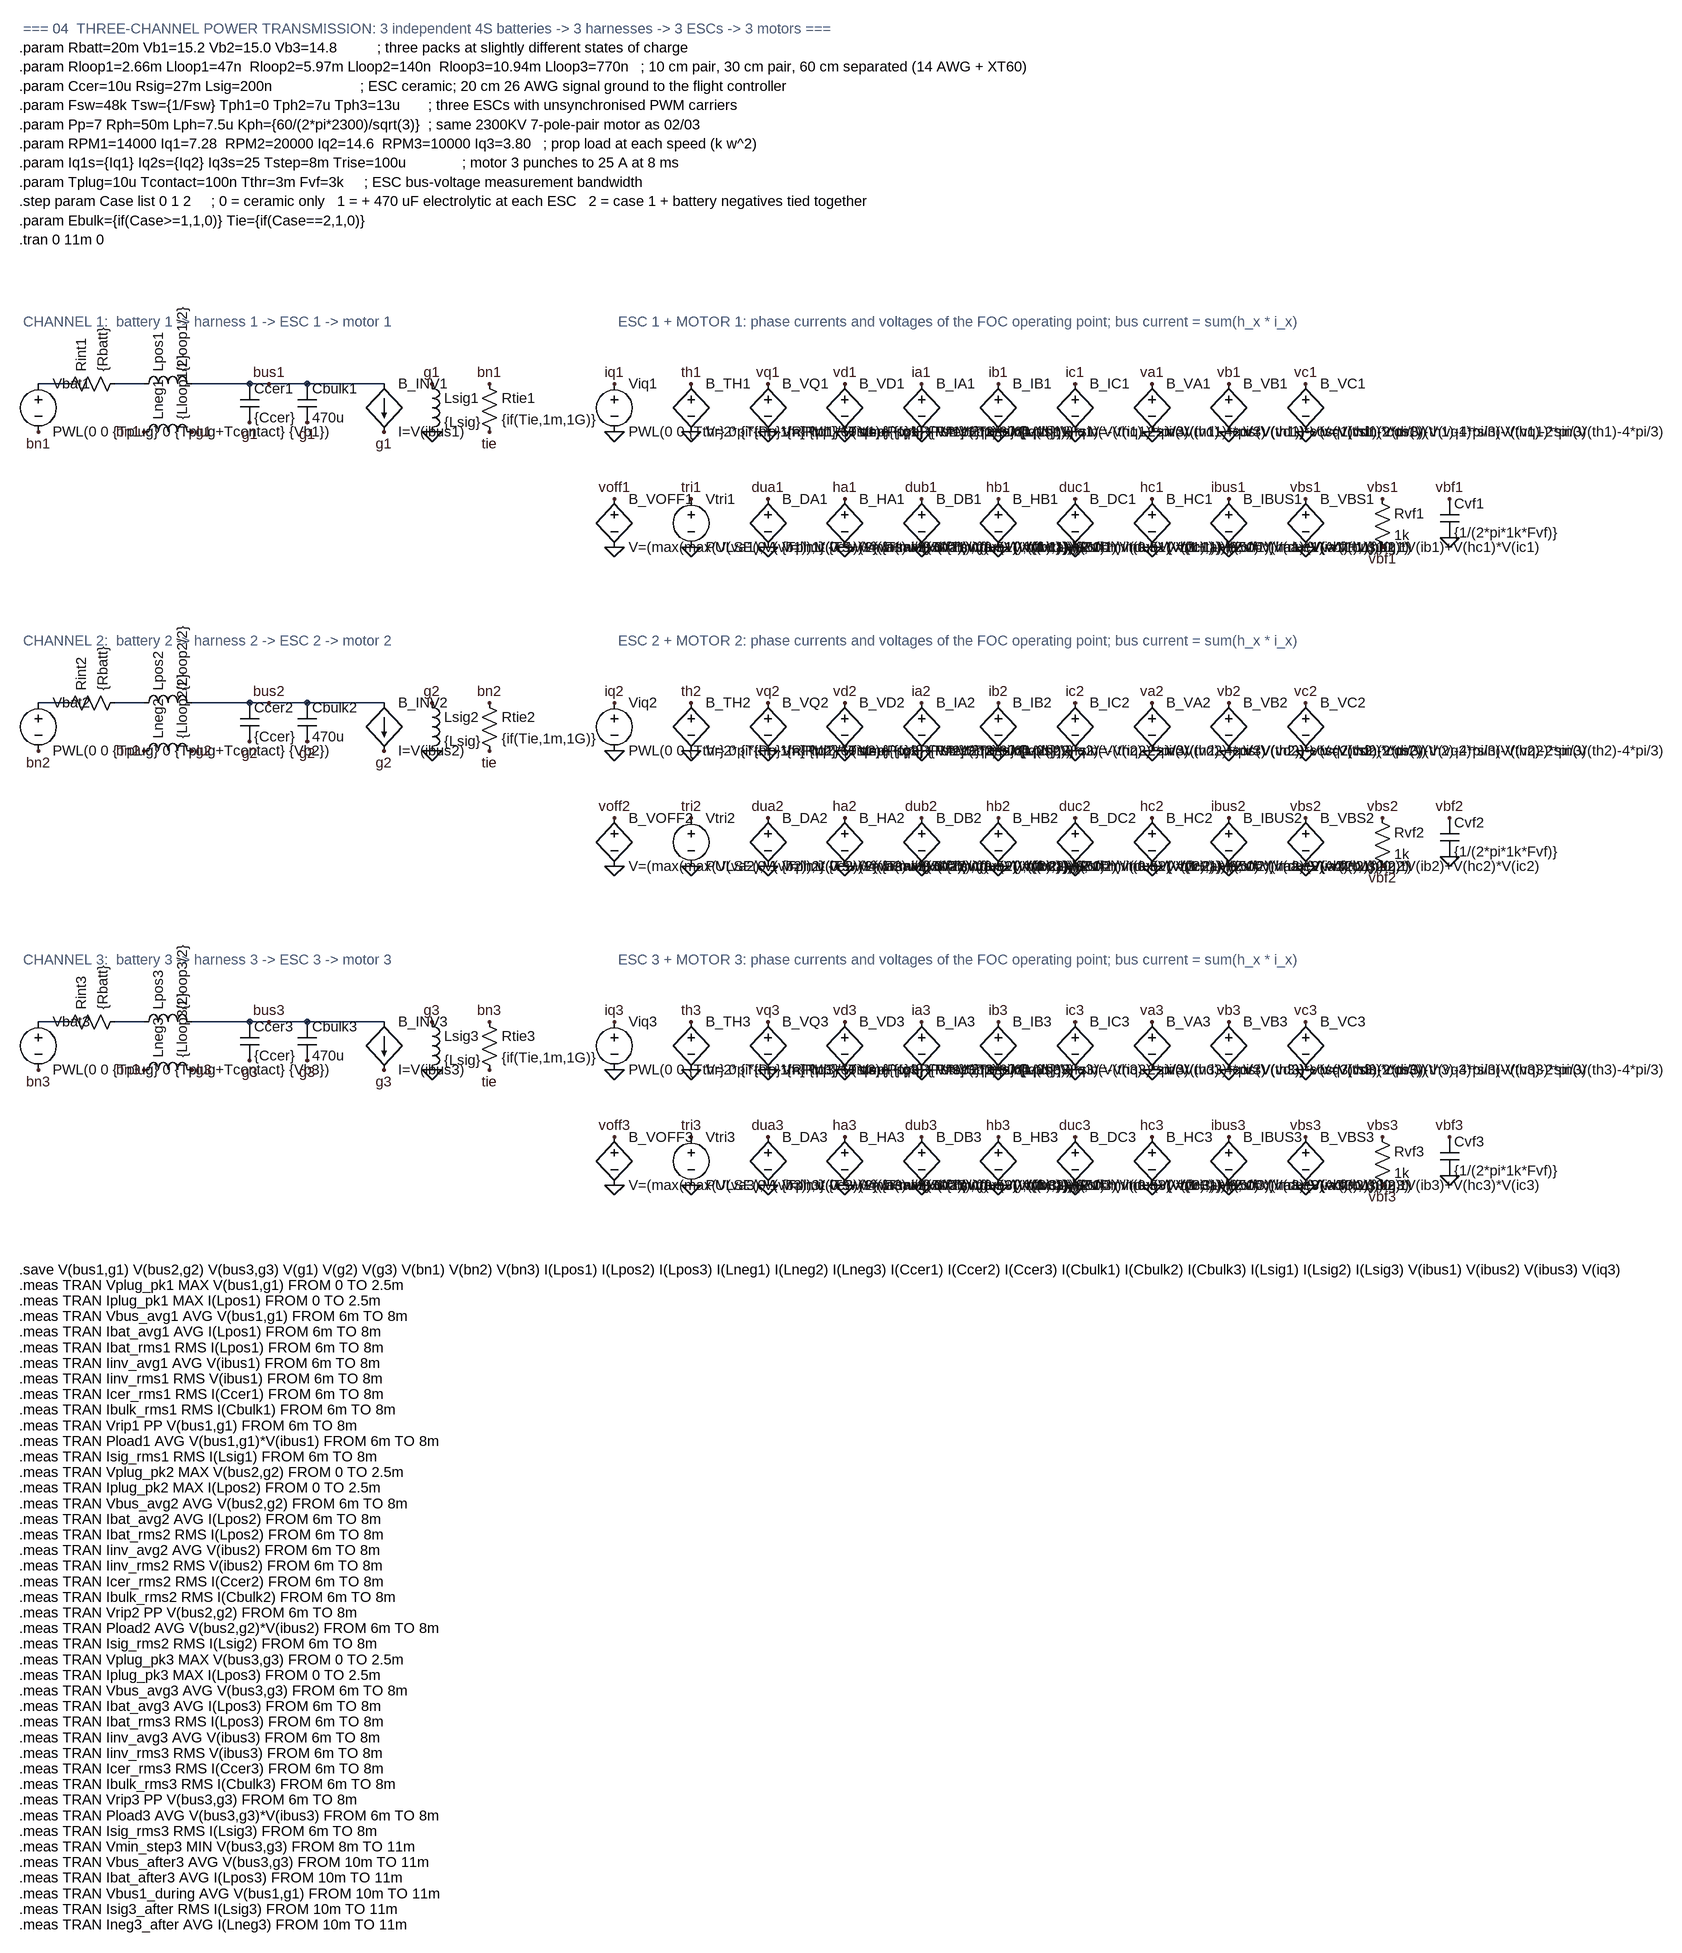
[diagram p0: schematic ThreeChannel_Transmission.asc]
ThreeChannel_Transmission.asc, the LTspice schematic file:
Version 4
SHEET 1 3600 2200
TEXT 32 40 Left 2 ; CHANNEL 1:  battery 1 -> harness 1 -> ESC 1 -> motor 1
SYMBOL voltage 64 128 R0
SYMATTR InstName Vbat1
SYMATTR Value PWL(0 0 {Tplug} 0 {Tplug+Tcontact} {Vb1})
FLAG 64 224 bn1
SYMBOL res 96 160 R270
SYMATTR InstName Rint1
SYMATTR Value {Rbatt}
WIRE 64 144 112 144
SYMBOL ind 224 160 R270
SYMATTR InstName Lpos1
SYMATTR Value {Lloop1/2}
SYMATTR SpiceLine Rser={Rloop1/2}
WIRE 192 144 240 144
SYMBOL ind 224 240 R270
SYMATTR InstName Lneg1
SYMATTR Value {Lloop1/2}
SYMATTR SpiceLine Rser={Rloop1/2}
FLAG 240 224 bn1
FLAG 320 224 g1
SYMBOL cap 400 144 R0
SYMATTR InstName Ccer1
SYMATTR Value {Ccer}
SYMATTR SpiceLine Rser=2m Lser=2n
FLAG 416 208 g1
SYMBOL cap 496 144 R0
SYMATTR InstName Cbulk1
SYMATTR Value 470u
SYMATTR SpiceLine Rser={if(Ebulk,30m,1Meg)} Lser=10n
FLAG 512 208 g1
WIRE 320 144 640 144
FLAG 448 144 bus1
SYMBOL bi 640 144 R0
SYMATTR InstName B_INV1
SYMATTR Value I=V(ibus1)
FLAG 640 224 g1
SYMBOL ind 704 128 R0
SYMATTR InstName Lsig1
SYMATTR Value {Lsig}
SYMATTR SpiceLine Rser={Rsig}
FLAG 720 144 g1
FLAG 720 224 0
SYMBOL res 800 128 R0
SYMATTR InstName Rtie1
SYMATTR Value {if(Tie,1m,1G)}
FLAG 816 144 bn1
FLAG 816 224 tie
SYMBOL voltage 1024 128 R0
SYMATTR InstName Viq1
SYMATTR Value PWL(0 0 {Tthr} 0 {Tthr+1m} {Iq1} {Tstep} {Iq1} {Tstep+Trise} {Iq1s})
FLAG 1024 144 iq1
FLAG 1024 224 0
SYMBOL bv 1152 128 R0
SYMATTR InstName B_TH1
SYMATTR Value V=2*pi*{Pp}*{RPM1}/60*time
FLAG 1152 144 th1
FLAG 1152 224 0
SYMBOL bv 1280 128 R0
SYMATTR InstName B_VQ1
SYMATTR Value V={Rph}*V(iq1)+{Kph}*{RPM1}*2*pi/60
FLAG 1280 144 vq1
FLAG 1280 224 0
SYMBOL bv 1408 128 R0
SYMATTR InstName B_VD1
SYMATTR Value V=-{Pp}*{RPM1}*2*pi/60*{Lph}*V(iq1)
FLAG 1408 144 vd1
FLAG 1408 224 0
SYMBOL bv 1536 128 R0
SYMATTR InstName B_IA1
SYMATTR Value V=-V(iq1)*sin(V(th1))
FLAG 1536 144 ia1
FLAG 1536 224 0
SYMBOL bv 1920 128 R0
SYMATTR InstName B_VA1
SYMATTR Value V=V(vd1)*cos(V(th1))-V(vq1)*sin(V(th1))
FLAG 1920 144 va1
FLAG 1920 224 0
SYMBOL bv 1664 128 R0
SYMATTR InstName B_IB1
SYMATTR Value V=-V(iq1)*sin(V(th1)-2*pi/3)
FLAG 1664 144 ib1
FLAG 1664 224 0
SYMBOL bv 2048 128 R0
SYMATTR InstName B_VB1
SYMATTR Value V=V(vd1)*cos(V(th1)-2*pi/3)-V(vq1)*sin(V(th1)-2*pi/3)
FLAG 2048 144 vb1
FLAG 2048 224 0
SYMBOL bv 1792 128 R0
SYMATTR InstName B_IC1
SYMATTR Value V=-V(iq1)*sin(V(th1)-4*pi/3)
FLAG 1792 144 ic1
FLAG 1792 224 0
SYMBOL bv 2176 128 R0
SYMATTR InstName B_VC1
SYMATTR Value V=V(vd1)*cos(V(th1)-4*pi/3)-V(vq1)*sin(V(th1)-4*pi/3)
FLAG 2176 144 vc1
FLAG 2176 224 0
SYMBOL bv 1024 320 R0
SYMATTR InstName B_VOFF1
SYMATTR Value V=(max(max(V(va1),V(vb1)),V(vc1))+min(min(V(va1),V(vb1)),V(vc1)))/2
FLAG 1024 336 voff1
FLAG 1024 416 0
SYMBOL voltage 1152 320 R0
SYMATTR InstName Vtri1
SYMATTR Value PULSE(0 1 {Tph1} {Tsw/2} {Tsw/2} 0 {Tsw})
FLAG 1152 336 tri1
FLAG 1152 416 0
SYMBOL bv 1280 320 R0
SYMATTR InstName B_DA1
SYMATTR Value V=limit(0.5+(V(va1)-V(voff1))/max(V(vbf1),1), 0, 1)
FLAG 1280 336 dua1
FLAG 1280 416 0
SYMBOL bv 1408 320 R0
SYMATTR InstName B_HA1
SYMATTR Value V=(1+tanh(500*(V(dua1)-V(tri1))))/2
FLAG 1408 336 ha1
FLAG 1408 416 0
SYMBOL bv 1536 320 R0
SYMATTR InstName B_DB1
SYMATTR Value V=limit(0.5+(V(vb1)-V(voff1))/max(V(vbf1),1), 0, 1)
FLAG 1536 336 dub1
FLAG 1536 416 0
SYMBOL bv 1664 320 R0
SYMATTR InstName B_HB1
SYMATTR Value V=(1+tanh(500*(V(dub1)-V(tri1))))/2
FLAG 1664 336 hb1
FLAG 1664 416 0
SYMBOL bv 1792 320 R0
SYMATTR InstName B_DC1
SYMATTR Value V=limit(0.5+(V(vc1)-V(voff1))/max(V(vbf1),1), 0, 1)
FLAG 1792 336 duc1
FLAG 1792 416 0
SYMBOL bv 1920 320 R0
SYMATTR InstName B_HC1
SYMATTR Value V=(1+tanh(500*(V(duc1)-V(tri1))))/2
FLAG 1920 336 hc1
FLAG 1920 416 0
SYMBOL bv 2048 320 R0
SYMATTR InstName B_IBUS1
SYMATTR Value V=V(ha1)*V(ia1)+V(hb1)*V(ib1)+V(hc1)*V(ic1)
FLAG 2048 336 ibus1
FLAG 2048 416 0
SYMBOL bv 2176 320 R0
SYMATTR InstName B_VBS1
SYMATTR Value V=V(bus1,g1)
FLAG 2176 336 vbs1
FLAG 2176 416 0
SYMBOL res 2288 320 R0
SYMATTR InstName Rvf1
SYMATTR Value 1k
FLAG 2304 336 vbs1
FLAG 2304 416 vbf1
SYMBOL cap 2400 336 R0
SYMATTR InstName Cvf1
SYMATTR Value {1/(2*pi*1k*Fvf)}
FLAG 2416 336 vbf1
FLAG 2416 400 0
TEXT 1024 40 Left 2 ; ESC 1 + MOTOR 1: phase currents and voltages of the FOC operating point; bus current = sum(h_x * i_x)
TEXT 32 600 Left 2 ; CHANNEL 2:  battery 2 -> harness 2 -> ESC 2 -> motor 2
SYMBOL voltage 64 688 R0
SYMATTR InstName Vbat2
SYMATTR Value PWL(0 0 {Tplug} 0 {Tplug+Tcontact} {Vb2})
FLAG 64 784 bn2
SYMBOL res 96 720 R270
SYMATTR InstName Rint2
SYMATTR Value {Rbatt}
WIRE 64 704 112 704
SYMBOL ind 224 720 R270
SYMATTR InstName Lpos2
SYMATTR Value {Lloop2/2}
SYMATTR SpiceLine Rser={Rloop2/2}
WIRE 192 704 240 704
SYMBOL ind 224 800 R270
SYMATTR InstName Lneg2
SYMATTR Value {Lloop2/2}
SYMATTR SpiceLine Rser={Rloop2/2}
FLAG 240 784 bn2
FLAG 320 784 g2
SYMBOL cap 400 704 R0
SYMATTR InstName Ccer2
SYMATTR Value {Ccer}
SYMATTR SpiceLine Rser=2m Lser=2n
FLAG 416 768 g2
SYMBOL cap 496 704 R0
SYMATTR InstName Cbulk2
SYMATTR Value 470u
SYMATTR SpiceLine Rser={if(Ebulk,30m,1Meg)} Lser=10n
FLAG 512 768 g2
WIRE 320 704 640 704
FLAG 448 704 bus2
SYMBOL bi 640 704 R0
SYMATTR InstName B_INV2
SYMATTR Value I=V(ibus2)
FLAG 640 784 g2
SYMBOL ind 704 688 R0
SYMATTR InstName Lsig2
SYMATTR Value {Lsig}
SYMATTR SpiceLine Rser={Rsig}
FLAG 720 704 g2
FLAG 720 784 0
SYMBOL res 800 688 R0
SYMATTR InstName Rtie2
SYMATTR Value {if(Tie,1m,1G)}
FLAG 816 704 bn2
FLAG 816 784 tie
SYMBOL voltage 1024 688 R0
SYMATTR InstName Viq2
SYMATTR Value PWL(0 0 {Tthr} 0 {Tthr+1m} {Iq2} {Tstep} {Iq2} {Tstep+Trise} {Iq2s})
FLAG 1024 704 iq2
FLAG 1024 784 0
SYMBOL bv 1152 688 R0
SYMATTR InstName B_TH2
SYMATTR Value V=2*pi*{Pp}*{RPM2}/60*time
FLAG 1152 704 th2
FLAG 1152 784 0
SYMBOL bv 1280 688 R0
SYMATTR InstName B_VQ2
SYMATTR Value V={Rph}*V(iq2)+{Kph}*{RPM2}*2*pi/60
FLAG 1280 704 vq2
FLAG 1280 784 0
SYMBOL bv 1408 688 R0
SYMATTR InstName B_VD2
SYMATTR Value V=-{Pp}*{RPM2}*2*pi/60*{Lph}*V(iq2)
FLAG 1408 704 vd2
FLAG 1408 784 0
SYMBOL bv 1536 688 R0
SYMATTR InstName B_IA2
SYMATTR Value V=-V(iq2)*sin(V(th2))
FLAG 1536 704 ia2
FLAG 1536 784 0
SYMBOL bv 1920 688 R0
SYMATTR InstName B_VA2
SYMATTR Value V=V(vd2)*cos(V(th2))-V(vq2)*sin(V(th2))
FLAG 1920 704 va2
FLAG 1920 784 0
SYMBOL bv 1664 688 R0
SYMATTR InstName B_IB2
SYMATTR Value V=-V(iq2)*sin(V(th2)-2*pi/3)
FLAG 1664 704 ib2
FLAG 1664 784 0
SYMBOL bv 2048 688 R0
SYMATTR InstName B_VB2
SYMATTR Value V=V(vd2)*cos(V(th2)-2*pi/3)-V(vq2)*sin(V(th2)-2*pi/3)
FLAG 2048 704 vb2
FLAG 2048 784 0
SYMBOL bv 1792 688 R0
SYMATTR InstName B_IC2
SYMATTR Value V=-V(iq2)*sin(V(th2)-4*pi/3)
FLAG 1792 704 ic2
FLAG 1792 784 0
SYMBOL bv 2176 688 R0
SYMATTR InstName B_VC2
SYMATTR Value V=V(vd2)*cos(V(th2)-4*pi/3)-V(vq2)*sin(V(th2)-4*pi/3)
FLAG 2176 704 vc2
FLAG 2176 784 0
SYMBOL bv 1024 880 R0
SYMATTR InstName B_VOFF2
SYMATTR Value V=(max(max(V(va2),V(vb2)),V(vc2))+min(min(V(va2),V(vb2)),V(vc2)))/2
FLAG 1024 896 voff2
FLAG 1024 976 0
SYMBOL voltage 1152 880 R0
SYMATTR InstName Vtri2
SYMATTR Value PULSE(0 1 {Tph2} {Tsw/2} {Tsw/2} 0 {Tsw})
FLAG 1152 896 tri2
FLAG 1152 976 0
SYMBOL bv 1280 880 R0
SYMATTR InstName B_DA2
SYMATTR Value V=limit(0.5+(V(va2)-V(voff2))/max(V(vbf2),1), 0, 1)
FLAG 1280 896 dua2
FLAG 1280 976 0
SYMBOL bv 1408 880 R0
SYMATTR InstName B_HA2
SYMATTR Value V=(1+tanh(500*(V(dua2)-V(tri2))))/2
FLAG 1408 896 ha2
FLAG 1408 976 0
SYMBOL bv 1536 880 R0
SYMATTR InstName B_DB2
SYMATTR Value V=limit(0.5+(V(vb2)-V(voff2))/max(V(vbf2),1), 0, 1)
FLAG 1536 896 dub2
FLAG 1536 976 0
SYMBOL bv 1664 880 R0
SYMATTR InstName B_HB2
SYMATTR Value V=(1+tanh(500*(V(dub2)-V(tri2))))/2
FLAG 1664 896 hb2
FLAG 1664 976 0
SYMBOL bv 1792 880 R0
SYMATTR InstName B_DC2
SYMATTR Value V=limit(0.5+(V(vc2)-V(voff2))/max(V(vbf2),1), 0, 1)
FLAG 1792 896 duc2
FLAG 1792 976 0
SYMBOL bv 1920 880 R0
SYMATTR InstName B_HC2
SYMATTR Value V=(1+tanh(500*(V(duc2)-V(tri2))))/2
FLAG 1920 896 hc2
FLAG 1920 976 0
SYMBOL bv 2048 880 R0
SYMATTR InstName B_IBUS2
SYMATTR Value V=V(ha2)*V(ia2)+V(hb2)*V(ib2)+V(hc2)*V(ic2)
FLAG 2048 896 ibus2
FLAG 2048 976 0
SYMBOL bv 2176 880 R0
SYMATTR InstName B_VBS2
SYMATTR Value V=V(bus2,g2)
FLAG 2176 896 vbs2
FLAG 2176 976 0
SYMBOL res 2288 880 R0
SYMATTR InstName Rvf2
SYMATTR Value 1k
FLAG 2304 896 vbs2
FLAG 2304 976 vbf2
SYMBOL cap 2400 896 R0
SYMATTR InstName Cvf2
SYMATTR Value {1/(2*pi*1k*Fvf)}
FLAG 2416 896 vbf2
FLAG 2416 960 0
TEXT 1024 600 Left 2 ; ESC 2 + MOTOR 2: phase currents and voltages of the FOC operating point; bus current = sum(h_x * i_x)
TEXT 32 1160 Left 2 ; CHANNEL 3:  battery 3 -> harness 3 -> ESC 3 -> motor 3
SYMBOL voltage 64 1248 R0
SYMATTR InstName Vbat3
SYMATTR Value PWL(0 0 {Tplug} 0 {Tplug+Tcontact} {Vb3})
FLAG 64 1344 bn3
SYMBOL res 96 1280 R270
SYMATTR InstName Rint3
SYMATTR Value {Rbatt}
WIRE 64 1264 112 1264
SYMBOL ind 224 1280 R270
SYMATTR InstName Lpos3
SYMATTR Value {Lloop3/2}
SYMATTR SpiceLine Rser={Rloop3/2}
WIRE 192 1264 240 1264
SYMBOL ind 224 1360 R270
SYMATTR InstName Lneg3
SYMATTR Value {Lloop3/2}
SYMATTR SpiceLine Rser={Rloop3/2}
FLAG 240 1344 bn3
FLAG 320 1344 g3
SYMBOL cap 400 1264 R0
SYMATTR InstName Ccer3
SYMATTR Value {Ccer}
SYMATTR SpiceLine Rser=2m Lser=2n
FLAG 416 1328 g3
SYMBOL cap 496 1264 R0
SYMATTR InstName Cbulk3
SYMATTR Value 470u
SYMATTR SpiceLine Rser={if(Ebulk,30m,1Meg)} Lser=10n
FLAG 512 1328 g3
WIRE 320 1264 640 1264
FLAG 448 1264 bus3
SYMBOL bi 640 1264 R0
SYMATTR InstName B_INV3
SYMATTR Value I=V(ibus3)
FLAG 640 1344 g3
SYMBOL ind 704 1248 R0
SYMATTR InstName Lsig3
SYMATTR Value {Lsig}
SYMATTR SpiceLine Rser={Rsig}
FLAG 720 1264 g3
FLAG 720 1344 0
SYMBOL res 800 1248 R0
SYMATTR InstName Rtie3
SYMATTR Value {if(Tie,1m,1G)}
FLAG 816 1264 bn3
FLAG 816 1344 tie
SYMBOL voltage 1024 1248 R0
SYMATTR InstName Viq3
SYMATTR Value PWL(0 0 {Tthr} 0 {Tthr+1m} {Iq3} {Tstep} {Iq3} {Tstep+Trise} {Iq3s})
FLAG 1024 1264 iq3
FLAG 1024 1344 0
SYMBOL bv 1152 1248 R0
SYMATTR InstName B_TH3
SYMATTR Value V=2*pi*{Pp}*{RPM3}/60*time
FLAG 1152 1264 th3
FLAG 1152 1344 0
SYMBOL bv 1280 1248 R0
SYMATTR InstName B_VQ3
SYMATTR Value V={Rph}*V(iq3)+{Kph}*{RPM3}*2*pi/60
FLAG 1280 1264 vq3
FLAG 1280 1344 0
SYMBOL bv 1408 1248 R0
SYMATTR InstName B_VD3
SYMATTR Value V=-{Pp}*{RPM3}*2*pi/60*{Lph}*V(iq3)
FLAG 1408 1264 vd3
FLAG 1408 1344 0
SYMBOL bv 1536 1248 R0
SYMATTR InstName B_IA3
SYMATTR Value V=-V(iq3)*sin(V(th3))
FLAG 1536 1264 ia3
FLAG 1536 1344 0
SYMBOL bv 1920 1248 R0
SYMATTR InstName B_VA3
SYMATTR Value V=V(vd3)*cos(V(th3))-V(vq3)*sin(V(th3))
FLAG 1920 1264 va3
FLAG 1920 1344 0
SYMBOL bv 1664 1248 R0
SYMATTR InstName B_IB3
SYMATTR Value V=-V(iq3)*sin(V(th3)-2*pi/3)
FLAG 1664 1264 ib3
FLAG 1664 1344 0
SYMBOL bv 2048 1248 R0
SYMATTR InstName B_VB3
SYMATTR Value V=V(vd3)*cos(V(th3)-2*pi/3)-V(vq3)*sin(V(th3)-2*pi/3)
FLAG 2048 1264 vb3
FLAG 2048 1344 0
SYMBOL bv 1792 1248 R0
SYMATTR InstName B_IC3
SYMATTR Value V=-V(iq3)*sin(V(th3)-4*pi/3)
FLAG 1792 1264 ic3
FLAG 1792 1344 0
SYMBOL bv 2176 1248 R0
SYMATTR InstName B_VC3
SYMATTR Value V=V(vd3)*cos(V(th3)-4*pi/3)-V(vq3)*sin(V(th3)-4*pi/3)
FLAG 2176 1264 vc3
FLAG 2176 1344 0
SYMBOL bv 1024 1440 R0
SYMATTR InstName B_VOFF3
SYMATTR Value V=(max(max(V(va3),V(vb3)),V(vc3))+min(min(V(va3),V(vb3)),V(vc3)))/2
FLAG 1024 1456 voff3
FLAG 1024 1536 0
SYMBOL voltage 1152 1440 R0
SYMATTR InstName Vtri3
SYMATTR Value PULSE(0 1 {Tph3} {Tsw/2} {Tsw/2} 0 {Tsw})
FLAG 1152 1456 tri3
FLAG 1152 1536 0
SYMBOL bv 1280 1440 R0
SYMATTR InstName B_DA3
SYMATTR Value V=limit(0.5+(V(va3)-V(voff3))/max(V(vbf3),1), 0, 1)
FLAG 1280 1456 dua3
FLAG 1280 1536 0
SYMBOL bv 1408 1440 R0
SYMATTR InstName B_HA3
SYMATTR Value V=(1+tanh(500*(V(dua3)-V(tri3))))/2
FLAG 1408 1456 ha3
FLAG 1408 1536 0
SYMBOL bv 1536 1440 R0
SYMATTR InstName B_DB3
SYMATTR Value V=limit(0.5+(V(vb3)-V(voff3))/max(V(vbf3),1), 0, 1)
FLAG 1536 1456 dub3
FLAG 1536 1536 0
SYMBOL bv 1664 1440 R0
SYMATTR InstName B_HB3
SYMATTR Value V=(1+tanh(500*(V(dub3)-V(tri3))))/2
FLAG 1664 1456 hb3
FLAG 1664 1536 0
SYMBOL bv 1792 1440 R0
SYMATTR InstName B_DC3
SYMATTR Value V=limit(0.5+(V(vc3)-V(voff3))/max(V(vbf3),1), 0, 1)
FLAG 1792 1456 duc3
FLAG 1792 1536 0
SYMBOL bv 1920 1440 R0
SYMATTR InstName B_HC3
SYMATTR Value V=(1+tanh(500*(V(duc3)-V(tri3))))/2
FLAG 1920 1456 hc3
FLAG 1920 1536 0
SYMBOL bv 2048 1440 R0
SYMATTR InstName B_IBUS3
SYMATTR Value V=V(ha3)*V(ia3)+V(hb3)*V(ib3)+V(hc3)*V(ic3)
FLAG 2048 1456 ibus3
FLAG 2048 1536 0
SYMBOL bv 2176 1440 R0
SYMATTR InstName B_VBS3
SYMATTR Value V=V(bus3,g3)
FLAG 2176 1456 vbs3
FLAG 2176 1536 0
SYMBOL res 2288 1440 R0
SYMATTR InstName Rvf3
SYMATTR Value 1k
FLAG 2304 1456 vbs3
FLAG 2304 1536 vbf3
SYMBOL cap 2400 1456 R0
SYMATTR InstName Cvf3
SYMATTR Value {1/(2*pi*1k*Fvf)}
FLAG 2416 1456 vbf3
FLAG 2416 1520 0
TEXT 1024 1160 Left 2 ; ESC 3 + MOTOR 3: phase currents and voltages of the FOC operating point; bus current = sum(h_x * i_x)
TEXT 32 -460 Left 2 ; === 04  THREE-CHANNEL POWER TRANSMISSION: 3 independent 4S batteries -> 3 harnesses -> 3 ESCs -> 3 motors ===
TEXT 32 -428 Left 2 !.param Rbatt=20m Vb1=15.2 Vb2=15.0 Vb3=14.8          ; three packs at slightly different states of charge
TEXT 32 -396 Left 2 !.param Rloop1=2.66m Lloop1=47n  Rloop2=5.97m Lloop2=140n  Rloop3=10.94m Lloop3=770n   ; 10 cm pair, 30 cm pair, 60 cm separated (14 AWG + XT60)
TEXT 32 -364 Left 2 !.param Ccer=10u Rsig=27m Lsig=200n                      ; ESC ceramic; 20 cm 26 AWG signal ground to the flight controller
TEXT 32 -332 Left 2 !.param Fsw=48k Tsw={1/Fsw} Tph1=0 Tph2=7u Tph3=13u       ; three ESCs with unsynchronised PWM carriers
TEXT 32 -300 Left 2 !.param Pp=7 Rph=50m Lph=7.5u Kph={60/(2*pi*2300)/sqrt(3)}  ; same 2300KV 7-pole-pair motor as 02/03
TEXT 32 -268 Left 2 !.param RPM1=14000 Iq1=7.28  RPM2=20000 Iq2=14.6  RPM3=10000 Iq3=3.80   ; prop load at each speed (k w^2)
TEXT 32 -236 Left 2 !.param Iq1s={Iq1} Iq2s={Iq2} Iq3s=25 Tstep=8m Trise=100u              ; motor 3 punches to 25 A at 8 ms
TEXT 32 -204 Left 2 !.param Tplug=10u Tcontact=100n Tthr=3m Fvf=3k     ; ESC bus-voltage measurement bandwidth
TEXT 32 -172 Left 2 !.step param Case list 0 1 2     ; 0 = ceramic only   1 = + 470 uF electrolytic at each ESC   2 = case 1 + battery negatives tied together
TEXT 32 -140 Left 2 !.param Ebulk={if(Case>=1,1,0)} Tie={if(Case==2,1,0)}
TEXT 32 -108 Left 2 !.tran 0 11m 0
TEXT 32 1720 Left 2 !.save V(bus1,g1) V(bus2,g2) V(bus3,g3) V(g1) V(g2) V(g3) V(bn1) V(bn2) V(bn3) I(Lpos1) I(Lpos2) I(Lpos3) I(Lneg1) I(Lneg2) I(Lneg3) I(Ccer1) I(Ccer2) I(Ccer3) I(Cbulk1) I(Cbulk2) I(Cbulk3) I(Lsig1) I(Lsig2) I(Lsig3) V(ibus1) V(ibus2) V(ibus3) V(iq3)
TEXT 32 1746 Left 2 !.meas TRAN Vplug_pk1 MAX V(bus1,g1) FROM 0 TO 2.5m
TEXT 32 1772 Left 2 !.meas TRAN Iplug_pk1 MAX I(Lpos1) FROM 0 TO 2.5m
TEXT 32 1798 Left 2 !.meas TRAN Vbus_avg1 AVG V(bus1,g1) FROM 6m TO 8m
TEXT 32 1824 Left 2 !.meas TRAN Ibat_avg1 AVG I(Lpos1) FROM 6m TO 8m
TEXT 32 1850 Left 2 !.meas TRAN Ibat_rms1 RMS I(Lpos1) FROM 6m TO 8m
TEXT 32 1876 Left 2 !.meas TRAN Iinv_avg1 AVG V(ibus1) FROM 6m TO 8m
TEXT 32 1902 Left 2 !.meas TRAN Iinv_rms1 RMS V(ibus1) FROM 6m TO 8m
TEXT 32 1928 Left 2 !.meas TRAN Icer_rms1 RMS I(Ccer1) FROM 6m TO 8m
TEXT 32 1954 Left 2 !.meas TRAN Ibulk_rms1 RMS I(Cbulk1) FROM 6m TO 8m
TEXT 32 1980 Left 2 !.meas TRAN Vrip1 PP V(bus1,g1) FROM 6m TO 8m
TEXT 32 2006 Left 2 !.meas TRAN Pload1 AVG V(bus1,g1)*V(ibus1) FROM 6m TO 8m
TEXT 32 2032 Left 2 !.meas TRAN Isig_rms1 RMS I(Lsig1) FROM 6m TO 8m
TEXT 32 2058 Left 2 !.meas TRAN Vplug_pk2 MAX V(bus2,g2) FROM 0 TO 2.5m
TEXT 32 2084 Left 2 !.meas TRAN Iplug_pk2 MAX I(Lpos2) FROM 0 TO 2.5m
TEXT 32 2110 Left 2 !.meas TRAN Vbus_avg2 AVG V(bus2,g2) FROM 6m TO 8m
TEXT 32 2136 Left 2 !.meas TRAN Ibat_avg2 AVG I(Lpos2) FROM 6m TO 8m
TEXT 32 2162 Left 2 !.meas TRAN Ibat_rms2 RMS I(Lpos2) FROM 6m TO 8m
TEXT 32 2188 Left 2 !.meas TRAN Iinv_avg2 AVG V(ibus2) FROM 6m TO 8m
TEXT 32 2214 Left 2 !.meas TRAN Iinv_rms2 RMS V(ibus2) FROM 6m TO 8m
TEXT 32 2240 Left 2 !.meas TRAN Icer_rms2 RMS I(Ccer2) FROM 6m TO 8m
TEXT 32 2266 Left 2 !.meas TRAN Ibulk_rms2 RMS I(Cbulk2) FROM 6m TO 8m
TEXT 32 2292 Left 2 !.meas TRAN Vrip2 PP V(bus2,g2) FROM 6m TO 8m
TEXT 32 2318 Left 2 !.meas TRAN Pload2 AVG V(bus2,g2)*V(ibus2) FROM 6m TO 8m
TEXT 32 2344 Left 2 !.meas TRAN Isig_rms2 RMS I(Lsig2) FROM 6m TO 8m
TEXT 32 2370 Left 2 !.meas TRAN Vplug_pk3 MAX V(bus3,g3) FROM 0 TO 2.5m
TEXT 32 2396 Left 2 !.meas TRAN Iplug_pk3 MAX I(Lpos3) FROM 0 TO 2.5m
TEXT 32 2422 Left 2 !.meas TRAN Vbus_avg3 AVG V(bus3,g3) FROM 6m TO 8m
TEXT 32 2448 Left 2 !.meas TRAN Ibat_avg3 AVG I(Lpos3) FROM 6m TO 8m
TEXT 32 2474 Left 2 !.meas TRAN Ibat_rms3 RMS I(Lpos3) FROM 6m TO 8m
TEXT 32 2500 Left 2 !.meas TRAN Iinv_avg3 AVG V(ibus3) FROM 6m TO 8m
TEXT 32 2526 Left 2 !.meas TRAN Iinv_rms3 RMS V(ibus3) FROM 6m TO 8m
TEXT 32 2552 Left 2 !.meas TRAN Icer_rms3 RMS I(Ccer3) FROM 6m TO 8m
TEXT 32 2578 Left 2 !.meas TRAN Ibulk_rms3 RMS I(Cbulk3) FROM 6m TO 8m
TEXT 32 2604 Left 2 !.meas TRAN Vrip3 PP V(bus3,g3) FROM 6m TO 8m
TEXT 32 2630 Left 2 !.meas TRAN Pload3 AVG V(bus3,g3)*V(ibus3) FROM 6m TO 8m
TEXT 32 2656 Left 2 !.meas TRAN Isig_rms3 RMS I(Lsig3) FROM 6m TO 8m
TEXT 32 2682 Left 2 !.meas TRAN Vmin_step3 MIN V(bus3,g3) FROM 8m TO 11m
TEXT 32 2708 Left 2 !.meas TRAN Vbus_after3 AVG V(bus3,g3) FROM 10m TO 11m
TEXT 32 2734 Left 2 !.meas TRAN Ibat_after3 AVG I(Lpos3) FROM 10m TO 11m
TEXT 32 2760 Left 2 !.meas TRAN Vbus1_during AVG V(bus1,g1) FROM 10m TO 11m
TEXT 32 2786 Left 2 !.meas TRAN Isig3_after RMS I(Lsig3) FROM 10m TO 11m
TEXT 32 2812 Left 2 !.meas TRAN Ineg3_after AVG I(Lneg3) FROM 10m TO 11m

The netlist it stands for:
* ThreeChannel_Transmission.asc
Vbat1 N001 bn1 PWL(0 0 {Tplug} 0 {Tplug+Tcontact} {Vb1})
Rint1 N001 N002 {Rbatt}
Lpos1 N002 bus1 {Lloop1/2} Rser={Rloop1/2}
Lneg1 bn1 g1 {Lloop1/2} Rser={Rloop1/2}
Ccer1 bus1 g1 {Ccer} Rser=2m Lser=2n
Cbulk1 bus1 g1 470u Rser={if(Ebulk,30m,1Meg)} Lser=10n
B_INV1 bus1 g1 I=V(ibus1)
Lsig1 g1 0 {Lsig} Rser={Rsig}
Rtie1 bn1 tie {if(Tie,1m,1G)}
Viq1 iq1 0 PWL(0 0 {Tthr} 0 {Tthr+1m} {Iq1} {Tstep} {Iq1} {Tstep+Trise} {Iq1s})
B_TH1 th1 0 V=2*pi*{Pp}*{RPM1}/60*time
B_VQ1 vq1 0 V={Rph}*V(iq1)+{Kph}*{RPM1}*2*pi/60
B_VD1 vd1 0 V=-{Pp}*{RPM1}*2*pi/60*{Lph}*V(iq1)
B_IA1 ia1 0 V=-V(iq1)*sin(V(th1))
B_VA1 va1 0 V=V(vd1)*cos(V(th1))-V(vq1)*sin(V(th1))
B_IB1 ib1 0 V=-V(iq1)*sin(V(th1)-2*pi/3)
B_VB1 vb1 0 V=V(vd1)*cos(V(th1)-2*pi/3)-V(vq1)*sin(V(th1)-2*pi/3)
B_IC1 ic1 0 V=-V(iq1)*sin(V(th1)-4*pi/3)
B_VC1 vc1 0 V=V(vd1)*cos(V(th1)-4*pi/3)-V(vq1)*sin(V(th1)-4*pi/3)
B_VOFF1 voff1 0 V=(max(max(V(va1),V(vb1)),V(vc1))+min(min(V(va1),V(vb1)),V(vc1)))/2
Vtri1 tri1 0 PULSE(0 1 {Tph1} {Tsw/2} {Tsw/2} 0 {Tsw})
B_DA1 dua1 0 V=limit(0.5+(V(va1)-V(voff1))/max(V(vbf1),1), 0, 1)
B_HA1 ha1 0 V=(1+tanh(500*(V(dua1)-V(tri1))))/2
B_DB1 dub1 0 V=limit(0.5+(V(vb1)-V(voff1))/max(V(vbf1),1), 0, 1)
B_HB1 hb1 0 V=(1+tanh(500*(V(dub1)-V(tri1))))/2
B_DC1 duc1 0 V=limit(0.5+(V(vc1)-V(voff1))/max(V(vbf1),1), 0, 1)
B_HC1 hc1 0 V=(1+tanh(500*(V(duc1)-V(tri1))))/2
B_IBUS1 ibus1 0 V=V(ha1)*V(ia1)+V(hb1)*V(ib1)+V(hc1)*V(ic1)
B_VBS1 vbs1 0 V=V(bus1,g1)
Rvf1 vbs1 vbf1 1k
Cvf1 vbf1 0 {1/(2*pi*1k*Fvf)}
Vbat2 N003 bn2 PWL(0 0 {Tplug} 0 {Tplug+Tcontact} {Vb2})
Rint2 N003 N004 {Rbatt}
Lpos2 N004 bus2 {Lloop2/2} Rser={Rloop2/2}
Lneg2 bn2 g2 {Lloop2/2} Rser={Rloop2/2}
Ccer2 bus2 g2 {Ccer} Rser=2m Lser=2n
Cbulk2 bus2 g2 470u Rser={if(Ebulk,30m,1Meg)} Lser=10n
B_INV2 bus2 g2 I=V(ibus2)
Lsig2 g2 0 {Lsig} Rser={Rsig}
Rtie2 bn2 tie {if(Tie,1m,1G)}
Viq2 iq2 0 PWL(0 0 {Tthr} 0 {Tthr+1m} {Iq2} {Tstep} {Iq2} {Tstep+Trise} {Iq2s})
B_TH2 th2 0 V=2*pi*{Pp}*{RPM2}/60*time
B_VQ2 vq2 0 V={Rph}*V(iq2)+{Kph}*{RPM2}*2*pi/60
B_VD2 vd2 0 V=-{Pp}*{RPM2}*2*pi/60*{Lph}*V(iq2)
B_IA2 ia2 0 V=-V(iq2)*sin(V(th2))
B_VA2 va2 0 V=V(vd2)*cos(V(th2))-V(vq2)*sin(V(th2))
B_IB2 ib2 0 V=-V(iq2)*sin(V(th2)-2*pi/3)
B_VB2 vb2 0 V=V(vd2)*cos(V(th2)-2*pi/3)-V(vq2)*sin(V(th2)-2*pi/3)
B_IC2 ic2 0 V=-V(iq2)*sin(V(th2)-4*pi/3)
B_VC2 vc2 0 V=V(vd2)*cos(V(th2)-4*pi/3)-V(vq2)*sin(V(th2)-4*pi/3)
B_VOFF2 voff2 0 V=(max(max(V(va2),V(vb2)),V(vc2))+min(min(V(va2),V(vb2)),V(vc2)))/2
Vtri2 tri2 0 PULSE(0 1 {Tph2} {Tsw/2} {Tsw/2} 0 {Tsw})
B_DA2 dua2 0 V=limit(0.5+(V(va2)-V(voff2))/max(V(vbf2),1), 0, 1)
B_HA2 ha2 0 V=(1+tanh(500*(V(dua2)-V(tri2))))/2
B_DB2 dub2 0 V=limit(0.5+(V(vb2)-V(voff2))/max(V(vbf2),1), 0, 1)
B_HB2 hb2 0 V=(1+tanh(500*(V(dub2)-V(tri2))))/2
B_DC2 duc2 0 V=limit(0.5+(V(vc2)-V(voff2))/max(V(vbf2),1), 0, 1)
B_HC2 hc2 0 V=(1+tanh(500*(V(duc2)-V(tri2))))/2
B_IBUS2 ibus2 0 V=V(ha2)*V(ia2)+V(hb2)*V(ib2)+V(hc2)*V(ic2)
B_VBS2 vbs2 0 V=V(bus2,g2)
Rvf2 vbs2 vbf2 1k
Cvf2 vbf2 0 {1/(2*pi*1k*Fvf)}
Vbat3 N005 bn3 PWL(0 0 {Tplug} 0 {Tplug+Tcontact} {Vb3})
Rint3 N005 N006 {Rbatt}
Lpos3 N006 bus3 {Lloop3/2} Rser={Rloop3/2}
Lneg3 bn3 g3 {Lloop3/2} Rser={Rloop3/2}
Ccer3 bus3 g3 {Ccer} Rser=2m Lser=2n
Cbulk3 bus3 g3 470u Rser={if(Ebulk,30m,1Meg)} Lser=10n
B_INV3 bus3 g3 I=V(ibus3)
Lsig3 g3 0 {Lsig} Rser={Rsig}
Rtie3 bn3 tie {if(Tie,1m,1G)}
Viq3 iq3 0 PWL(0 0 {Tthr} 0 {Tthr+1m} {Iq3} {Tstep} {Iq3} {Tstep+Trise} {Iq3s})
B_TH3 th3 0 V=2*pi*{Pp}*{RPM3}/60*time
B_VQ3 vq3 0 V={Rph}*V(iq3)+{Kph}*{RPM3}*2*pi/60
B_VD3 vd3 0 V=-{Pp}*{RPM3}*2*pi/60*{Lph}*V(iq3)
B_IA3 ia3 0 V=-V(iq3)*sin(V(th3))
B_VA3 va3 0 V=V(vd3)*cos(V(th3))-V(vq3)*sin(V(th3))
B_IB3 ib3 0 V=-V(iq3)*sin(V(th3)-2*pi/3)
B_VB3 vb3 0 V=V(vd3)*cos(V(th3)-2*pi/3)-V(vq3)*sin(V(th3)-2*pi/3)
B_IC3 ic3 0 V=-V(iq3)*sin(V(th3)-4*pi/3)
B_VC3 vc3 0 V=V(vd3)*cos(V(th3)-4*pi/3)-V(vq3)*sin(V(th3)-4*pi/3)
B_VOFF3 voff3 0 V=(max(max(V(va3),V(vb3)),V(vc3))+min(min(V(va3),V(vb3)),V(vc3)))/2
Vtri3 tri3 0 PULSE(0 1 {Tph3} {Tsw/2} {Tsw/2} 0 {Tsw})
B_DA3 dua3 0 V=limit(0.5+(V(va3)-V(voff3))/max(V(vbf3),1), 0, 1)
B_HA3 ha3 0 V=(1+tanh(500*(V(dua3)-V(tri3))))/2
B_DB3 dub3 0 V=limit(0.5+(V(vb3)-V(voff3))/max(V(vbf3),1), 0, 1)
B_HB3 hb3 0 V=(1+tanh(500*(V(dub3)-V(tri3))))/2
B_DC3 duc3 0 V=limit(0.5+(V(vc3)-V(voff3))/max(V(vbf3),1), 0, 1)
B_HC3 hc3 0 V=(1+tanh(500*(V(duc3)-V(tri3))))/2
B_IBUS3 ibus3 0 V=V(ha3)*V(ia3)+V(hb3)*V(ib3)+V(hc3)*V(ic3)
B_VBS3 vbs3 0 V=V(bus3,g3)
Rvf3 vbs3 vbf3 1k
Cvf3 vbf3 0 {1/(2*pi*1k*Fvf)}
*  CHANNEL 1:  battery 1 -> harness 1 -> ESC 1 -> motor 1
*  ESC 1 + MOTOR 1: phase currents and voltages of the FOC operating point; bus current = sum(h_x * i_x)
*  CHANNEL 2:  battery 2 -> harness 2 -> ESC 2 -> motor 2
*  ESC 2 + MOTOR 2: phase currents and voltages of the FOC operating point; bus current = sum(h_x * i_x)
*  CHANNEL 3:  battery 3 -> harness 3 -> ESC 3 -> motor 3
*  ESC 3 + MOTOR 3: phase currents and voltages of the FOC operating point; bus current = sum(h_x * i_x)
*  === 04  THREE-CHANNEL POWER TRANSMISSION: 3 independent 4S batteries -> 3 harnesses -> 3 ESCs -> 3 motors ===
.param Rbatt=20m Vb1=15.2 Vb2=15.0 Vb3=14.8          ; three packs at slightly different states of charge
.param Rloop1=2.66m Lloop1=47n  Rloop2=5.97m Lloop2=140n  Rloop3=10.94m Lloop3=770n   ; 10 cm pair, 30 cm pair, 60 cm separated (14 AWG + XT60)
.param Ccer=10u Rsig=27m Lsig=200n                      ; ESC ceramic; 20 cm 26 AWG signal ground to the flight controller
.param Fsw=48k Tsw={1/Fsw} Tph1=0 Tph2=7u Tph3=13u       ; three ESCs with unsynchronised PWM carriers
.param Pp=7 Rph=50m Lph=7.5u Kph={60/(2*pi*2300)/sqrt(3)}  ; same 2300KV 7-pole-pair motor as 02/03
.param RPM1=14000 Iq1=7.28  RPM2=20000 Iq2=14.6  RPM3=10000 Iq3=3.80   ; prop load at each speed (k w^2)
.param Iq1s={Iq1} Iq2s={Iq2} Iq3s=25 Tstep=8m Trise=100u              ; motor 3 punches to 25 A at 8 ms
.param Tplug=10u Tcontact=100n Tthr=3m Fvf=3k     ; ESC bus-voltage measurement bandwidth
.step param Case list 0 1 2     ; 0 = ceramic only   1 = + 470 uF electrolytic at each ESC   2 = case 1 + battery negatives tied together
.param Ebulk={if(Case>=1,1,0)} Tie={if(Case==2,1,0)}
.tran 0 11m 0
.save V(bus1,g1) V(bus2,g2) V(bus3,g3) V(g1) V(g2) V(g3) V(bn1) V(bn2) V(bn3) I(Lpos1) I(Lpos2) I(Lpos3) I(Lneg1) I(Lneg2) I(Lneg3) I(Ccer1) I(Ccer2) I(Ccer3) I(Cbulk1) I(Cbulk2) I(Cbulk3) I(Lsig1) I(Lsig2) I(Lsig3) V(ibus1) V(ibus2) V(ibus3) V(iq3)
.meas TRAN Vplug_pk1 MAX V(bus1,g1) FROM 0 TO 2.5m
.meas TRAN Iplug_pk1 MAX I(Lpos1) FROM 0 TO 2.5m
.meas TRAN Vbus_avg1 AVG V(bus1,g1) FROM 6m TO 8m
.meas TRAN Ibat_avg1 AVG I(Lpos1) FROM 6m TO 8m
.meas TRAN Ibat_rms1 RMS I(Lpos1) FROM 6m TO 8m
.meas TRAN Iinv_avg1 AVG V(ibus1) FROM 6m TO 8m
.meas TRAN Iinv_rms1 RMS V(ibus1) FROM 6m TO 8m
.meas TRAN Icer_rms1 RMS I(Ccer1) FROM 6m TO 8m
.meas TRAN Ibulk_rms1 RMS I(Cbulk1) FROM 6m TO 8m
.meas TRAN Vrip1 PP V(bus1,g1) FROM 6m TO 8m
.meas TRAN Pload1 AVG V(bus1,g1)*V(ibus1) FROM 6m TO 8m
.meas TRAN Isig_rms1 RMS I(Lsig1) FROM 6m TO 8m
.meas TRAN Vplug_pk2 MAX V(bus2,g2) FROM 0 TO 2.5m
.meas TRAN Iplug_pk2 MAX I(Lpos2) FROM 0 TO 2.5m
.meas TRAN Vbus_avg2 AVG V(bus2,g2) FROM 6m TO 8m
.meas TRAN Ibat_avg2 AVG I(Lpos2) FROM 6m TO 8m
.meas TRAN Ibat_rms2 RMS I(Lpos2) FROM 6m TO 8m
.meas TRAN Iinv_avg2 AVG V(ibus2) FROM 6m TO 8m
.meas TRAN Iinv_rms2 RMS V(ibus2) FROM 6m TO 8m
.meas TRAN Icer_rms2 RMS I(Ccer2) FROM 6m TO 8m
.meas TRAN Ibulk_rms2 RMS I(Cbulk2) FROM 6m TO 8m
.meas TRAN Vrip2 PP V(bus2,g2) FROM 6m TO 8m
.meas TRAN Pload2 AVG V(bus2,g2)*V(ibus2) FROM 6m TO 8m
.meas TRAN Isig_rms2 RMS I(Lsig2) FROM 6m TO 8m
.meas TRAN Vplug_pk3 MAX V(bus3,g3) FROM 0 TO 2.5m
.meas TRAN Iplug_pk3 MAX I(Lpos3) FROM 0 TO 2.5m
.meas TRAN Vbus_avg3 AVG V(bus3,g3) FROM 6m TO 8m
.meas TRAN Ibat_avg3 AVG I(Lpos3) FROM 6m TO 8m
.meas TRAN Ibat_rms3 RMS I(Lpos3) FROM 6m TO 8m
.meas TRAN Iinv_avg3 AVG V(ibus3) FROM 6m TO 8m
.meas TRAN Iinv_rms3 RMS V(ibus3) FROM 6m TO 8m
.meas TRAN Icer_rms3 RMS I(Ccer3) FROM 6m TO 8m
.meas TRAN Ibulk_rms3 RMS I(Cbulk3) FROM 6m TO 8m
.meas TRAN Vrip3 PP V(bus3,g3) FROM 6m TO 8m
.meas TRAN Pload3 AVG V(bus3,g3)*V(ibus3) FROM 6m TO 8m
.meas TRAN Isig_rms3 RMS I(Lsig3) FROM 6m TO 8m
.meas TRAN Vmin_step3 MIN V(bus3,g3) FROM 8m TO 11m
.meas TRAN Vbus_after3 AVG V(bus3,g3) FROM 10m TO 11m
.meas TRAN Ibat_after3 AVG I(Lpos3) FROM 10m TO 11m
.meas TRAN Vbus1_during AVG V(bus1,g1) FROM 10m TO 11m
.meas TRAN Isig3_after RMS I(Lsig3) FROM 10m TO 11m
.meas TRAN Ineg3_after AVG I(Lneg3) FROM 10m TO 11m
.backanno
.end